# Altium schematic sheet Sheet1.SchDoc
size A4
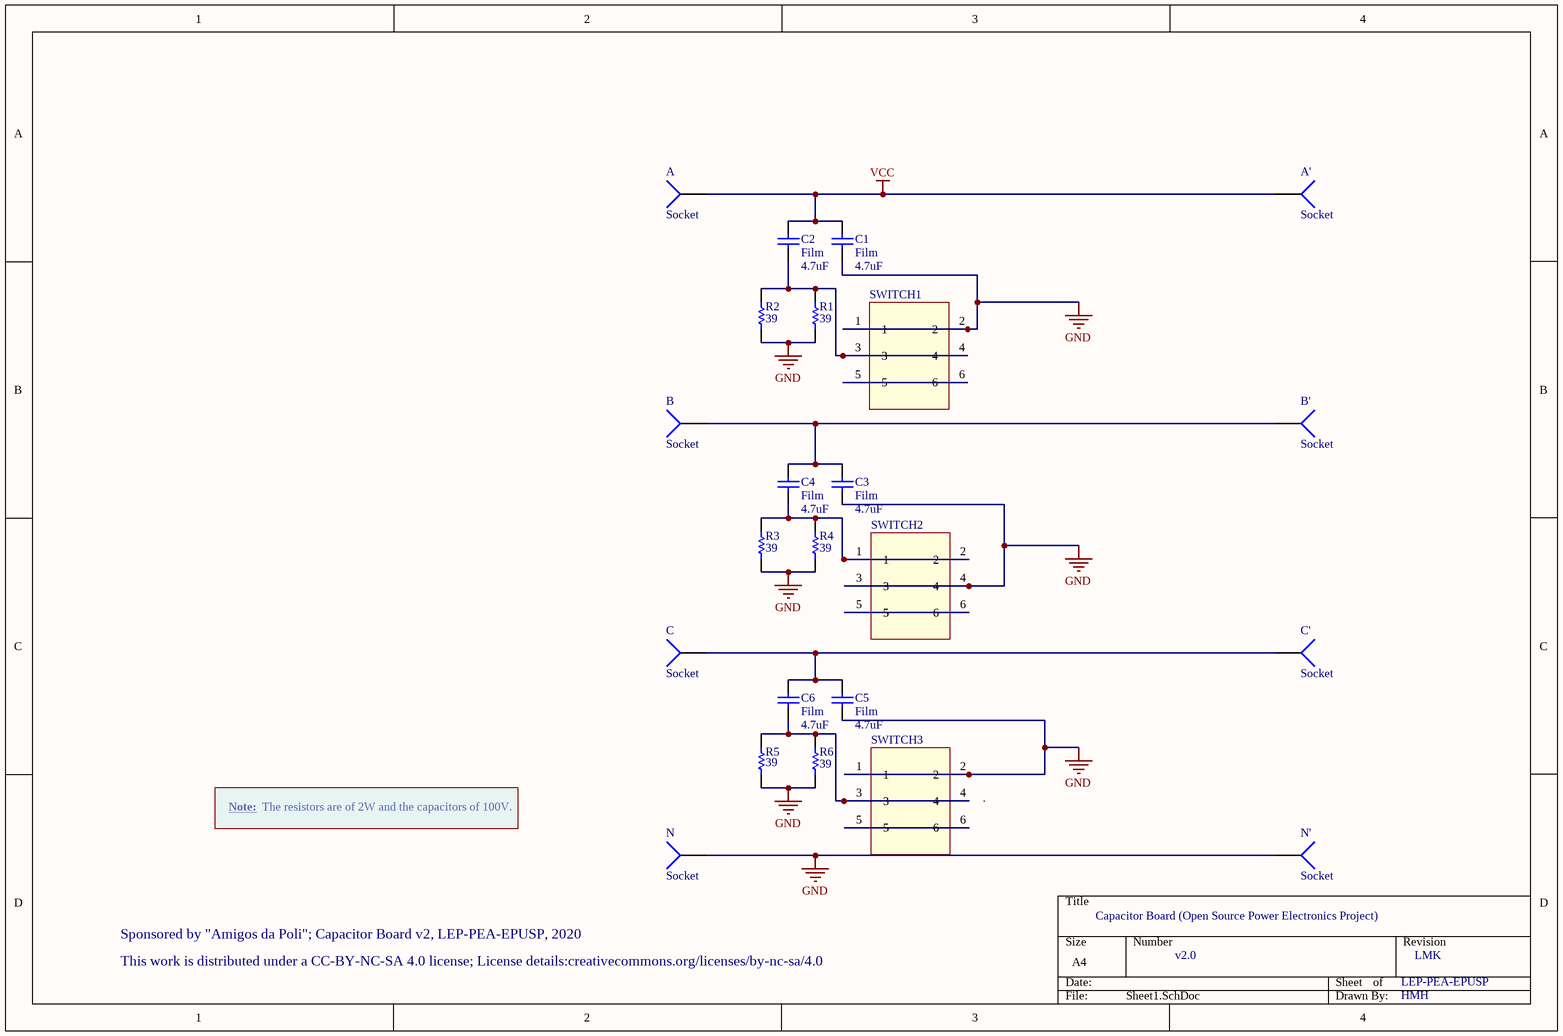
[diagram p0: Sheet1.SchDoc]

## Parts
A  Socket  [PCBComponent_1]
A'  Socket  [PCBComponent_1]
B  Socket  [PCBComponent_1]
B'  Socket  [PCBComponent_1]
C  Socket  [PCBComponent_1]
C1  Film  value 4.7uF  [PCBComponent_1]
C2  Film  value 4.7uF  [PCBComponent_1]
C3  Film  value 4.7uF  [PCBComponent_1]
C4  Film  value 4.7uF  [PCBComponent_1]
C5  Film  value 4.7uF  [PCBComponent_1]
C6  Film  value 4.7uF  [PCBComponent_1]
C'  Socket  [PCBComponent_1]
N  Socket  [PCBComponent_1]
N'  Socket  [PCBComponent_1]
R1  value 39  [AXIAL-0.6]  (hidden comment: 2W)
R2  value 39  [AXIAL-0.6]  (hidden comment: 2W)
R3  value 39  [AXIAL-0.6]  (hidden comment: 2W)
R4  value 39  [AXIAL-0.6]  (hidden comment: 2W)
R5  value 39  [AXIAL-0.6]  (hidden comment: 2W)
R6  value 39  [AXIAL-0.6]  (hidden comment: 2W)
SWITCH1  CHAVE  [PCBComponent_1]  (value not drawn)
SWITCH2  CHAVE  [PCBComponent_1]  (value not drawn)
SWITCH3  CHAVE  [PCBComponent_1]  (value not drawn)

## Nets
GND: C1.2 C3.2 C5.2 N.1 N'.1 R1.2 R2.2 R3.2 R4.2 R5.2 R6.2 SWITCH1.1 SWITCH1.2 SWITCH2.3 SWITCH2.4 SWITCH3.1 SWITCH3.2
VCC: A.1 A'.1 C1.1 C2.1
NetB_1: B.1 B'.1 C3.1 C4.1
NetC2_2: C2.2 R1.1 R2.1 SWITCH1.3 SWITCH1.4
NetC4_2: C4.2 R3.1 R4.1 SWITCH2.1 SWITCH2.2
NetC6_2: C6.2 R5.1 R6.1 SWITCH3.3 SWITCH3.4
NetC_1: C.1 C5.1 C6.1 C'.1
NetSWITCH1_5: SWITCH1.5 SWITCH1.6
NetSWITCH2_5: SWITCH2.5 SWITCH2.6
NetSWITCH3_5: SWITCH3.5 SWITCH3.6

## Notes on the sheet
- Note:
- The resistors are of 2W and the capacitors of 100V.
- Capacitor Board (Open Source Power Electronics Project)
- Sponsored by "Amigos da Poli"; Capacitor Board v2, LEP-PEA-EPUSP, 2020
- This work is distributed under a CC-BY-NC-SA 4.0 license; License details:creativecommons.org/licenses/by-nc-sa/4.0
- v2.0
- LEP-PEA-EPUSP
- LMK
- HMH

## Library data of the parts
C1-C6 = Cap: Capacitor; Published: 8-Jun-2000; LatestRevisionDate: 17-Jul-2002; LatestRevisionNote: Re-released for DXP Platform.; PackageReference: RAD-0.3; Publisher: Altium Limited; PackageDescription: Radial Cap, Thru-Hole; 2 Leads; 0.3 in Pin Spacing
R1-R6 = Res1: Resistor; Published: 8-Jun-2000; LatestRevisionDate: 17-Jul-2002; LatestRevisionNote: Re-released for DXP Platform.; PackageReference: AXIAL-0.3; Publisher: Altium Limited; PackageDescription: Axial Device, Thru-Hole; 2 Leads; 0.3 in Pin Spacing
A A' B B' C C' N N' = Socket: LatestRevisionDate: 17-Jul-2002; LatestRevisionNote: Re-released for DXP Platform.; Publisher: Altium Limited